# Altium schematic sheet Top_Sheet.SchDoc
size A4; SheetNumber: 1; SheetTotal: 5
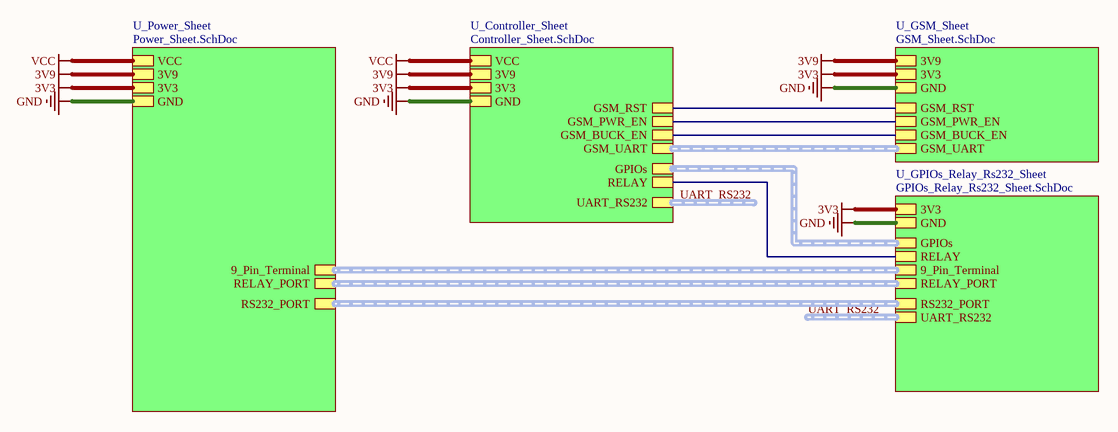
[diagram p0: Top_Sheet.SchDoc]

## Sub-sheets
U_Controller_Sheet = Controller_Sheet.SchDoc: GPIOs (harness GPIOs), RELAY, GSM_UART (harness GSM_UART), GSM_PWR_EN, GSM_RST, UART_RS232 (harness UART_RS232), GSM_BUCK_EN, GND, 3V3, 3V9, VCC
U_GPIOs_Relay_Rs232_Sheet = GPIOs_Relay_Rs232_Sheet.SchDoc: GPIOs (harness GPIOs), RELAY, RELAY_PORT (harness RELAY_PORT), GND, 3V3, 9_Pin_Terminal (harness 9_Pin_Terminal), RS232_PORT (harness RS232_PORT), UART_RS232 (harness UART_RS232)
U_GSM_Sheet = GSM_Sheet.SchDoc: GSM_UART (harness GSM_UART), GSM_PWR_EN, GSM_RST, GSM_BUCK_EN, GND, 3V3, 3V9
U_Power_Sheet = Power_Sheet.SchDoc: VCC, 3V9, GND, 3V3, RELAY_PORT (harness RELAY_PORT), RS232_PORT (harness RS232_PORT), 9_Pin_Terminal (harness RELAY_PORT)

## Nets
3V3: sheet U_Power_Sheet/3V3, sheet U_Controller_Sheet/3V3, sheet U_GSM_Sheet/3V3, sheet U_GPIOs_Relay_Rs232_Sheet/3V3
3V9: sheet U_Power_Sheet/3V9, sheet U_Controller_Sheet/3V9, sheet U_GSM_Sheet/3V9
GND: sheet U_Power_Sheet/GND, sheet U_Controller_Sheet/GND, sheet U_GSM_Sheet/GND, sheet U_GPIOs_Relay_Rs232_Sheet/GND
VCC: sheet U_Power_Sheet/VCC, sheet U_Controller_Sheet/VCC
(unnamed): sheet U_Controller_Sheet/RELAY, sheet U_GPIOs_Relay_Rs232_Sheet/RELAY
(unnamed): sheet U_Controller_Sheet/GSM_PWR_EN, sheet U_GSM_Sheet/GSM_PWR_EN
(unnamed): sheet U_Controller_Sheet/GSM_RST, sheet U_GSM_Sheet/GSM_RST
(unnamed): sheet U_Controller_Sheet/GSM_BUCK_EN, sheet U_GSM_Sheet/GSM_BUCK_EN

## Buses and harness runs
harness sheet U_Controller_Sheet/GPIOs = sheet U_GPIOs_Relay_Rs232_Sheet/GPIOs
harness sheet U_Controller_Sheet/GSM_UART = sheet U_GSM_Sheet/GSM_UART
harness sheet U_GPIOs_Relay_Rs232_Sheet/9_Pin_Terminal = sheet U_Power_Sheet/9_Pin_Terminal
harness sheet U_GPIOs_Relay_Rs232_Sheet/RELAY_PORT = sheet U_Power_Sheet/RELAY_PORT
harness sheet U_GPIOs_Relay_Rs232_Sheet/RS232_PORT = sheet U_Power_Sheet/RS232_PORT
harness UART_RS232 = sheet U_Controller_Sheet/UART_RS232
harness UART_RS232 = sheet U_GPIOs_Relay_Rs232_Sheet/UART_RS232

## Notes on the sheet
- File:
- Title:
- Date:
- Page
- Num:
- Total:
- Drawn By: Huzaifa Ali